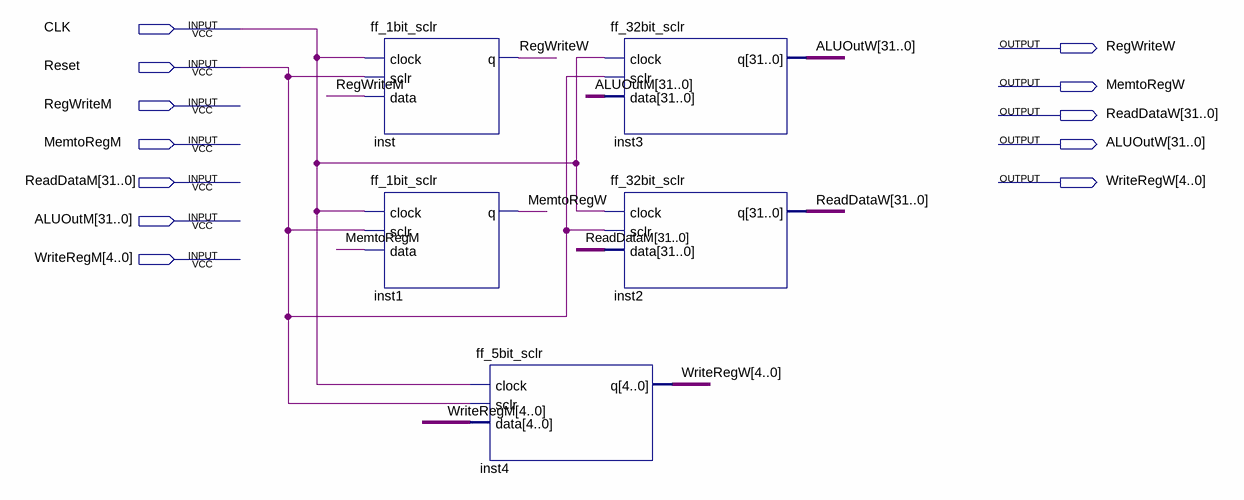
[diagram p0: schematic sheet]
// Quartus schematic MEM_WB_Reg.bdf as structural Verilog: 5 symbols, 12 pins
module MEM_WB_Reg (
  input  CLK,
  input  Reset,
  input  RegWriteM,
  input  MemtoRegM,
  input  [31:0] ReadDataM,
  input  [31:0] ALUOutM,
  input  [4:0] WriteRegM,
  output RegWriteW,
  output MemtoRegW,
  output [31:0] ReadDataW,
  output [31:0] ALUOutW,
  output [4:0] WriteRegW
);

  ff_1bit_sclr inst (.clock(CLK), .sclr(Reset), .data(RegWriteM), .q(RegWriteW));
  ff_1bit_sclr inst1 (.clock(CLK), .sclr(Reset), .data(MemtoRegM), .q(MemtoRegW));
  ff_5bit_sclr inst4 (.clock(CLK), .sclr(Reset), .data(WriteRegM), .q(WriteRegW));
  ff_32bit_sclr inst3 (.clock(CLK), .sclr(Reset), .data(ALUOutM), .q(ALUOutW));
  ff_32bit_sclr inst2 (.clock(CLK), .sclr(Reset), .data(ReadDataM), .q(ReadDataW));
endmodule
